# EasyEDA schematic schematic.json
TITLE: Macropad; REV: 3.0; Date: 2026-11-10; Sheet: 1/1; Drawn By: farukylmz0550; Company: farukylmz0550
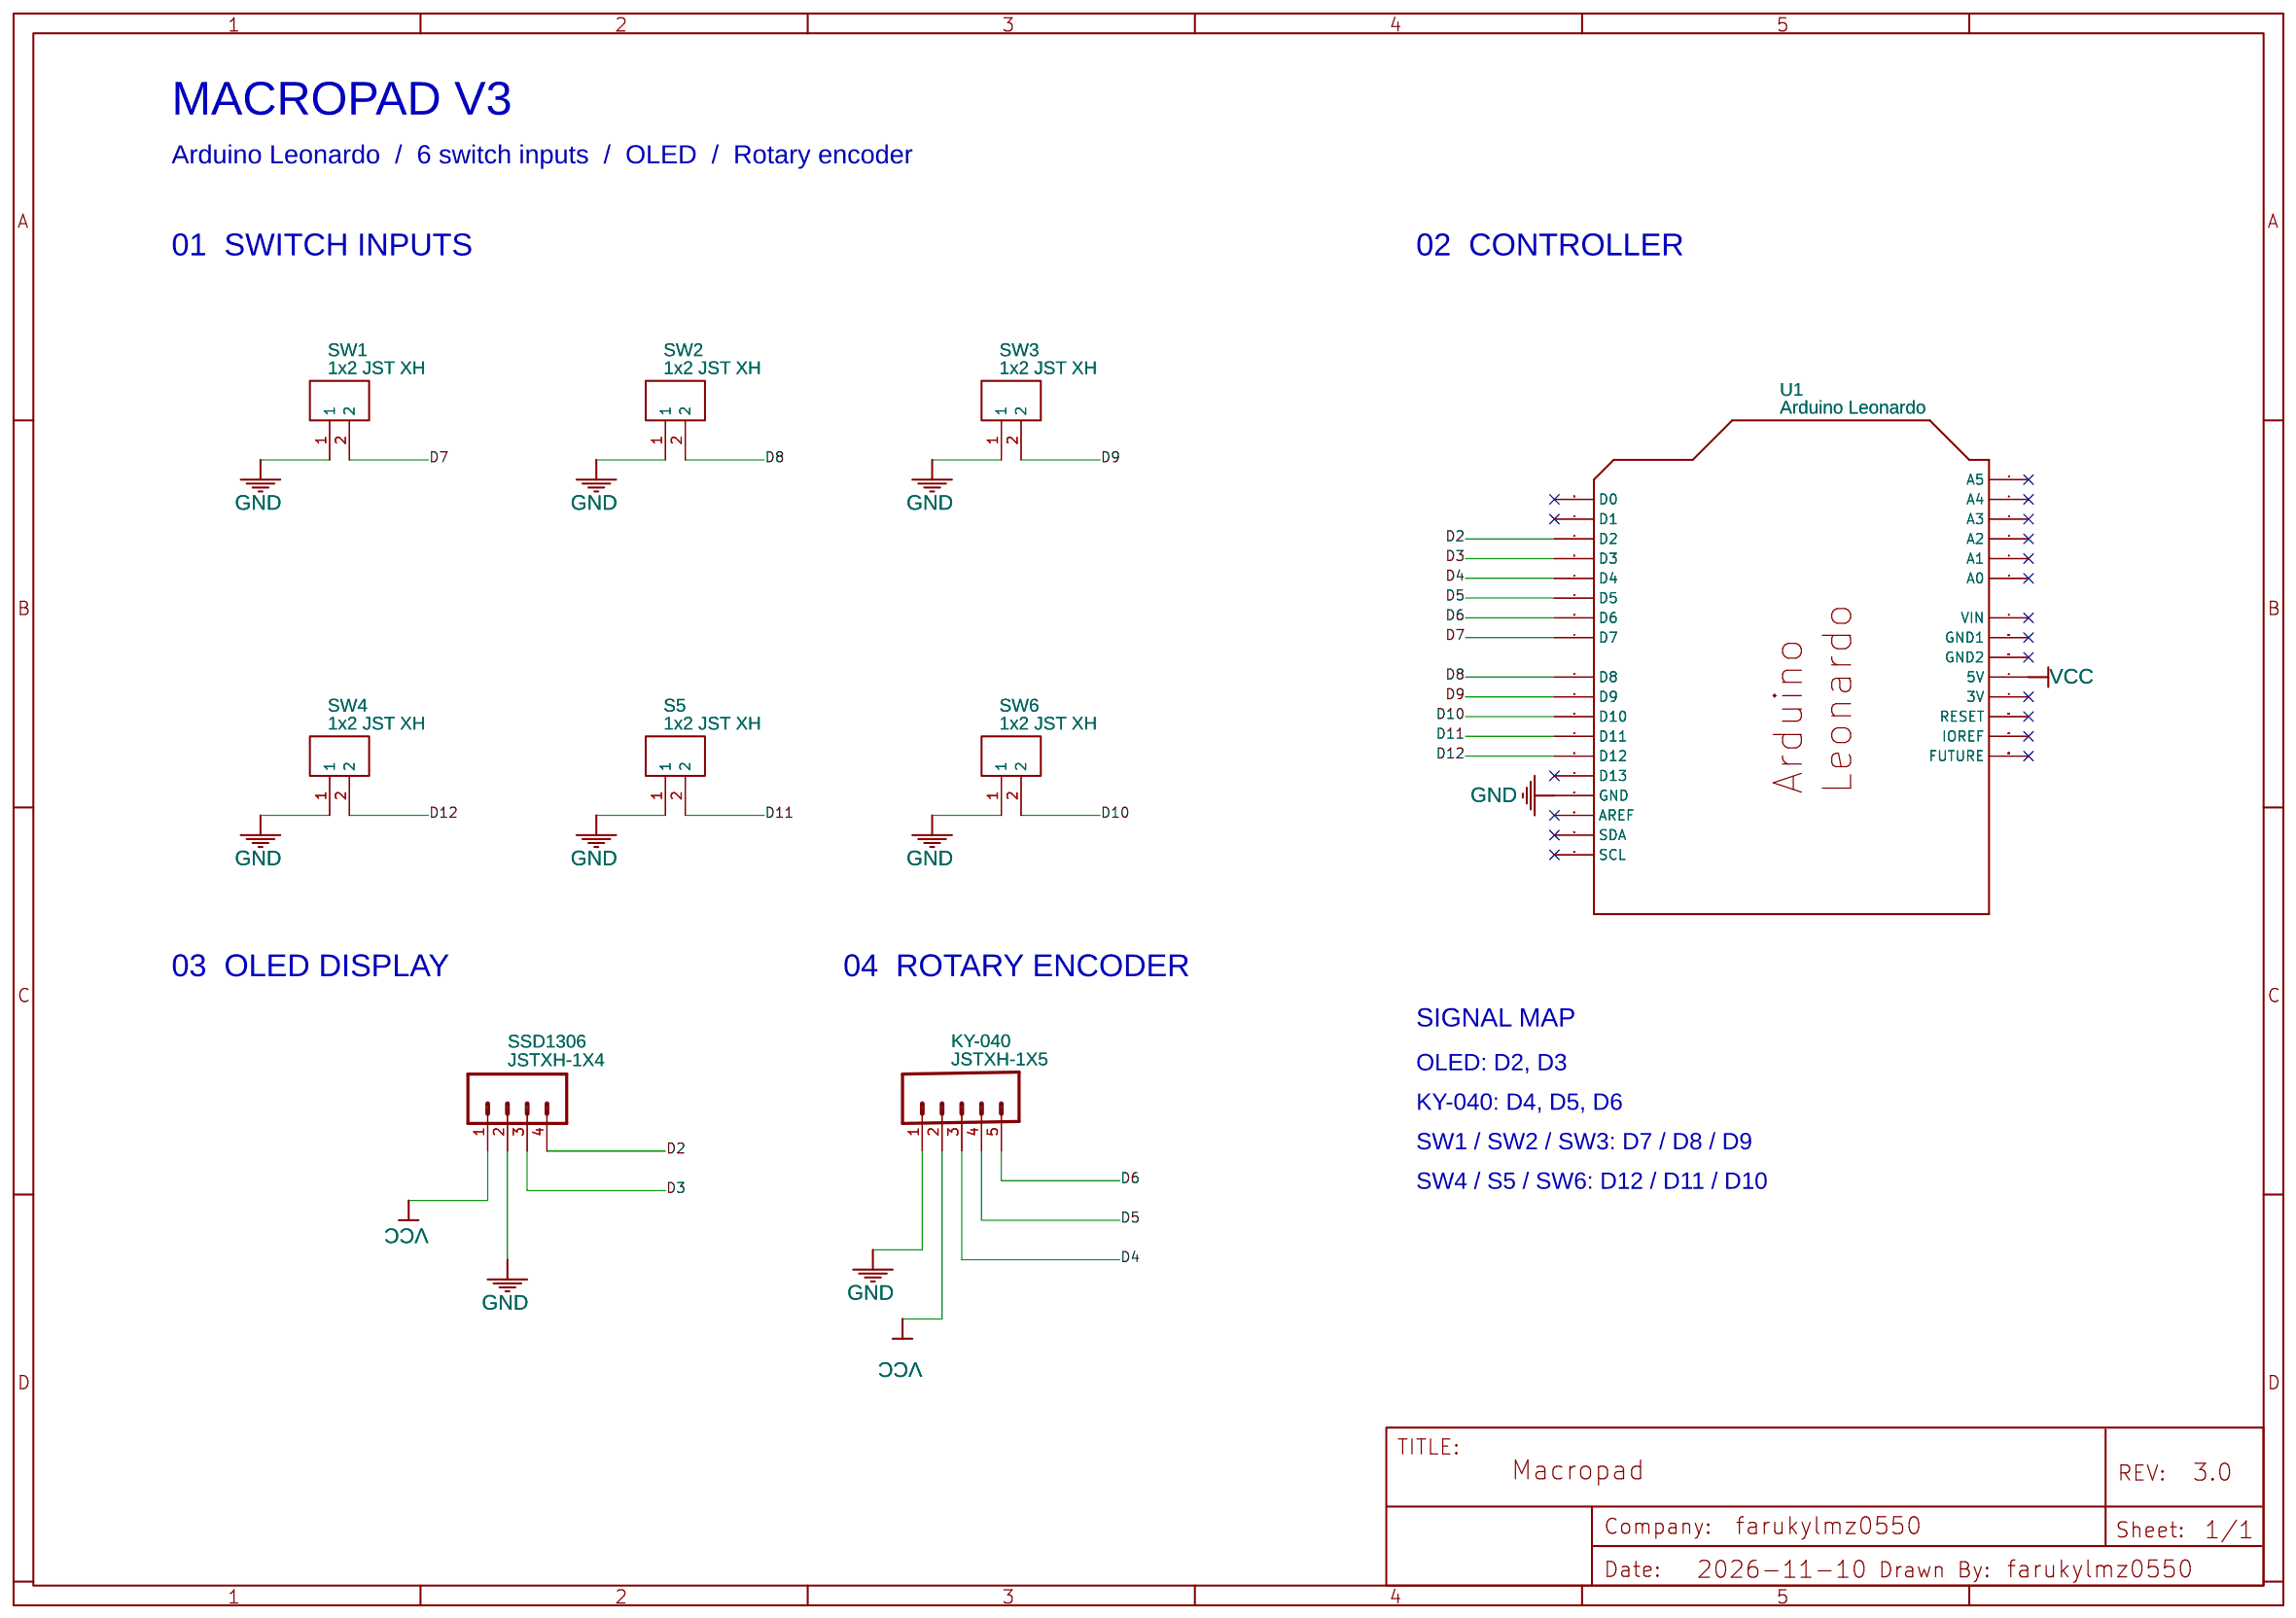
[diagram p0: schematic sheet]

## Parts
KY-040  JSTXH-1X5  [JSTXH-1X5]
S5  1x2 JST XH  [1X2 JST XH]
SSD1306  JSTXH-1X4  [JSTXH-1X4]
SW1  1x2 JST XH  [1X2 JST XH]
SW2  1x2 JST XH  [1X2 JST XH]
SW3  1x2 JST XH  [1X2 JST XH]
SW4  1x2 JST XH  [1X2 JST XH]
SW6  1x2 JST XH  [1X2 JST XH]
U1  Arduino Leonardo  [ARDUINO_LEONARDO]

## Library data of the parts
KY-040 = JSTXH-1X5: Contributor: dedetargz
S5 SW1-SW4 SW6 = 1x2 JST XH: Contributor: edelarosar1700
SSD1306 = JSTXH-1X4: Contributor: dedetargz
U1 = Arduino Leonardo

## Nets
GND: KY-040.1 S5.1 SSD1306.2 SW1.1 SW2.1 SW3.1 SW4.1 SW6.1 U1.GND
VCC: KY-040.2 SSD1306.1 U1.5V
D2: SSD1306.4 U1.D2
D3: SSD1306.3 U1.D3
D4: KY-040.3 U1.D4
D5: KY-040.4 U1.D5
D6: KY-040.5 U1.D6
D7: SW1.2 U1.D7
D8: SW2.2 U1.D8
D9: SW3.2 U1.D9
D10: SW6.2 U1.D10
D11: S5.2 U1.D11
D12: SW4.2 U1.D12

Not connected (* = marked no-connect by the designer): U1 3V* A0* A1* A2* A3* A4* A5* AREF* D0* D1* D13* GND$2(GND2)* GND$3(GND1)* IOREF* RESERVED(FUTURE)* RESET* SCL* SDA* VIN*

## Notes on the sheet
- MACROPAD V3
- Arduino Leonardo  /  6 switch inputs  /  OLED  /  Rotary encoder
- 01  SWITCH INPUTS
- 02  CONTROLLER
- 03  OLED DISPLAY
- 04  ROTARY ENCODER
- SIGNAL MAP
- OLED: D2, D3
- KY-040: D4, D5, D6
- SW1 / SW2 / SW3: D7 / D8 / D9
- SW4 / S5 / SW6: D12 / D11 / D10
